# Altium schematic sheet 07_USB_LED.SchDoc
size 271 x 114 mm; DsnPath: C:\Users\nilot\Documents\VSCode\SBC\imports\SG2002_QFN88_38_20230301_4L_V1.3_16.2.DSN; SchematicName: CV181xC_QFN88_38_DemoBoard; PageName: 07_USB_LED; PageSize: Custom; TopSchematic: True
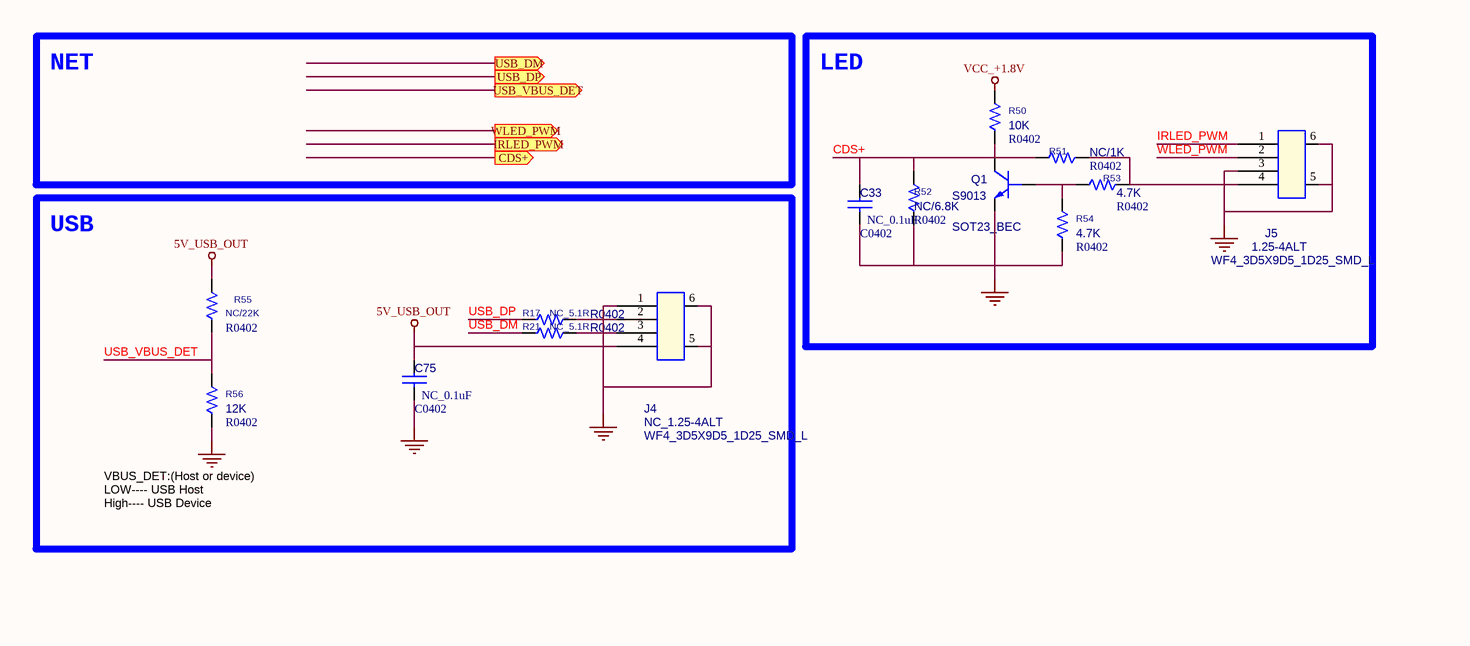
[diagram p0: 07_USB_LED.SchDoc, top left]
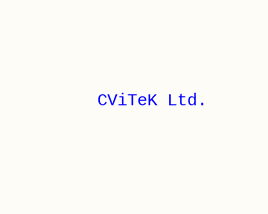
[diagram p1: 07_USB_LED.SchDoc, centre middle]
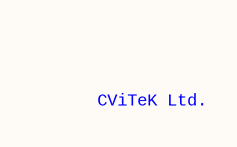
[diagram p2: 07_USB_LED.SchDoc, bottom right]

## Parts
C33  NC_0.1uF  [C0402]
C75  NC_0.1uF  [C0402]
J4  NC_1.25-4ALT  [WF4_3D5X9D5_1D25_SMD_L]
J5  1.25-4ALT  [WF4_3D5X9D5_1D25_SMD_L]
Q1  S9013  [SOT23_BEC]
R17  NC_5.1R  [R0402]
R21  NC_5.1R  [R0402]
R50  10K  [R0402]
R51  NC/1K  [R0402]
R52  NC/6.8K  [R0402]
R53  4.7K  [R0402]
R54  4.7K  [R0402]
R55  NC/22K  [R0402]
R56  12K  [R0402]

## Blocks framed on the sheet
LED: C33 J5 Q1 R50-R54
USB: C75 J4 R17 R21 R55 R56

## Ports
CDS+ (out), IRLED_PWM (out), USB_DM (out), USB_DP (out), USB_VBUS_DET (out), WLED_PWM (out)

## Nets
5V_USB_OUT: C75.1 J4.4 R55.2
GND: C33.2 C75.2 J4.1 J4.5 J4.6 J5.3 J5.5 J5.6 Q1.E R52.1 R54.1 R56.1
VCC_+1.8V: R50.2
CDS+: C33.1 Q1.C R50.1 R51.2 R52.2
IRLED_PWM: J5.1
USB_DM: R21.1
USB_DP: R17.1
USB_VBUS_DET: R55.1 R56.2
WLED_PWM: J5.2
NetJ4_2: J4.2 R17.2
NetJ4_3: J4.3 R21.2
NetJ5_4: J5.4 R51.1 R53.1
NetQ1_B: Q1.B R53.2 R54.2

## Notes on the sheet
- NET
- VBUS_DET:(Host or device)
  LOW---- USB Host
  High---- USB Device
- CViTeK Ltd.

## Library data of the parts
C33 = C: C0402; Part Number: GRM155R61E104KA87D; Part Reference: C33; Cloud IC Number: Y02110431K00; Vendor: murata; Part Name: C0402; Value: NC_0.1uF; PCB Footprint: C0402
C75 = C: C0402; Part Number: GRM155R61E104KA87D; Part Reference: C75; Cloud IC Number: Y02110431K00; Vendor: murata; Part Name: C0402; Value: NC_0.1uF; PCB Footprint: C0402
J4 = CON6_6: Part Reference: J4; Value: NC_1.25-4ALT; PCB Footprint: WF4_3D5X9D5_1D25_SMD_L
J5 = CON6_6: Part Reference: J5; Value: 1.25-4ALT; PCB Footprint: WF4_3D5X9D5_1D25_SMD_L
Q1 = 2N1069_4: S9013 SOT-23; Part Reference: Q1; Part Number: Y061S9013206; PspiceTemplate: Q^@REFDES %C %B %E; Value: S9013; Manufacturer Part number: Y061S9013206; PCB Footprint: SOT23_BEC
R17 = R_Dup2: Part Reference: R17; Value: NC_5.1R; PCB Footprint: R0402
R21 = R_Dup2: Part Reference: R21; Value: NC_5.1R; PCB Footprint: R0402
R50 = R_Dup1: R0402; Part Reference: R50; Manufacturer Part number: Y01101041F00; Accuracy: 1%; Vendor: yageo; Value: 10K; Part Name: R0402; Part Type: RES; Part Number: Y01101041F00; PCB Footprint: R0402
R51 = R_Dup1: R0402; Part Reference: R51; Manufacturer Part number: Y01101041F00; Accuracy: 1%; Vendor: yageo; Value: NC/1K; Part Name: R0402; Part Type: RES; Part Number: Y01101041F00; PCB Footprint: R0402
R52 = R_Dup1: R0402; Part Reference: R52; Manufacturer Part number: Y01101041F00; Accuracy: 1%; Vendor: yageo; Value: NC/6.8K; Part Name: R0402; Part Type: RES; Part Number: Y01101041F00; PCB Footprint: R0402
R53 = R_Dup1: R0402; Part Reference: R53; Part Number: Y01101041F00; Vendor: yageo; Accuracy: 1%; Value: 4.7K; Part Type: RES; Manufacturer Part number: Y01101041F00; Part Name: R0402; PCB Footprint: R0402
R54 = R_Dup1: R0402; Part Reference: R54; Manufacturer Part number: Y01101041F00; Accuracy: 1%; Vendor: yageo; Value: 4.7K; Part Name: R0402; Part Type: RES; Part Number: Y01101041F00; PCB Footprint: R0402
R55 = R_Dup1: R0402; Part Reference: R55; Value: NC/22K; PCB Footprint: R0402
R56 = R_Dup1: R0402; Part Reference: R56; Part Number: Y01101041F00; Vendor: yageo; Accuracy: 1%; Value: 12K; PCB Footprint: R0402; Part Type: RES; Manufacturer Part number: Y01101041F00; Part Name: R0402